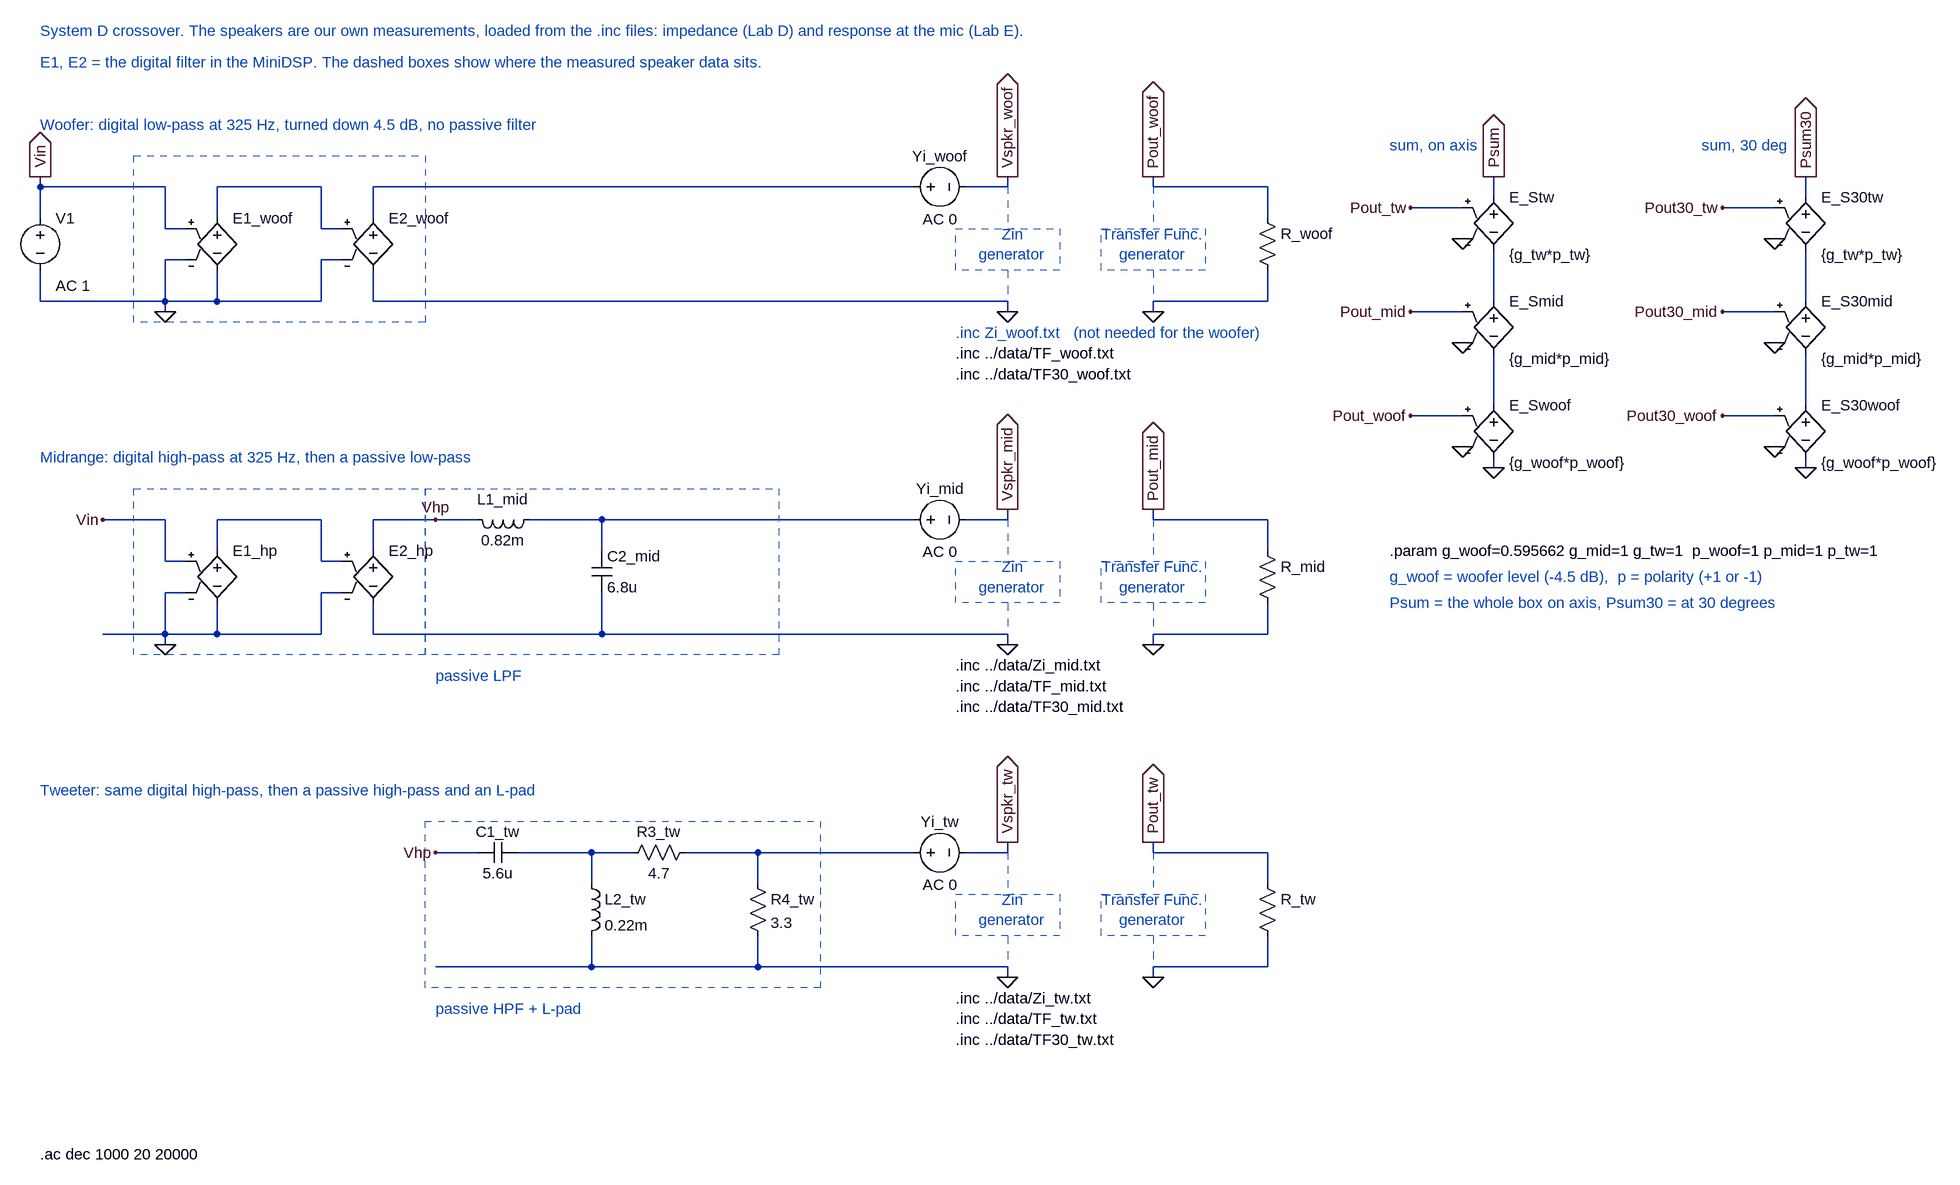
[diagram p0: schematic System_D_course.asc]
System_D_course.asc, the LTspice schematic file:
Version 4
SHEET 1 3600 2400
WIRE -336 64 -336 80
WIRE -336 80 -144 80
WIRE -336 128 -336 80
WIRE -336 208 -336 256
WIRE -336 256 -144 256
WIRE -144 80 -144 144
WIRE -144 144 -112 144
WIRE -112 192 -144 192
WIRE -144 192 -144 256
WIRE -64 128 -64 80
WIRE -64 80 96 80
WIRE 96 80 96 144
WIRE 96 144 128 144
WIRE -64 208 -64 256
WIRE -64 256 96 256
WIRE 96 256 96 192
WIRE 96 192 128 192
WIRE 176 128 176 80
WIRE 176 208 176 256
WIRE -144 256 -144 272
WIRE -144 256 -64 256
WIRE 176 80 1008 80
WIRE 1088 80 1152 80
WIRE 1152 64 1152 80
WIRE 1376 64 1376 80
WIRE 1376 80 1552 80
WIRE 1552 80 1552 128
WIRE 1552 208 1552 256
WIRE 1552 256 1376 256
WIRE 1376 256 1376 272
WIRE 1152 256 176 256
WIRE 1152 256 1152 272
WIRE -240 592 -144 592
WIRE -240 768 -144 768
WIRE -144 592 -144 656
WIRE -144 656 -112 656
WIRE -112 704 -144 704
WIRE -144 704 -144 768
WIRE -64 640 -64 592
WIRE -64 592 96 592
WIRE 96 592 96 656
WIRE 96 656 128 656
WIRE -64 720 -64 768
WIRE -64 768 96 768
WIRE 96 768 96 704
WIRE 96 704 128 704
WIRE 176 640 176 592
WIRE 176 720 176 768
WIRE -144 768 -144 784
WIRE -144 768 -64 768
WIRE 176 592 272 592
WIRE 176 768 272 768
WIRE 272 592 336 592
WIRE 416 592 464 592
WIRE 464 592 528 592
WIRE 528 592 528 640
WIRE 528 704 528 768
WIRE 528 592 592 592
WIRE 272 768 592 768
WIRE 592 592 1008 592
WIRE 1088 592 1152 592
WIRE 1152 576 1152 592
WIRE 1376 576 1376 592
WIRE 1376 592 1552 592
WIRE 1552 592 1552 640
WIRE 1552 720 1552 768
WIRE 1552 768 1376 768
WIRE 1376 768 1376 784
WIRE 1152 768 592 768
WIRE 1152 768 1152 784
WIRE 272 1104 336 1104
WIRE 400 1104 448 1104
WIRE 448 1104 512 1104
WIRE 512 1104 512 1152
WIRE 512 1232 512 1280
WIRE 512 1104 576 1104
WIRE 656 1104 704 1104
WIRE 704 1104 768 1104
WIRE 768 1104 768 1152
WIRE 768 1232 768 1280
WIRE 768 1104 832 1104
WIRE 272 1280 832 1280
WIRE 832 1104 1008 1104
WIRE 1088 1104 1152 1104
WIRE 1152 1088 1152 1104
WIRE 1376 1088 1376 1104
WIRE 1376 1104 1552 1104
WIRE 1552 1104 1552 1152
WIRE 1552 1232 1552 1280
WIRE 1552 1280 1376 1280
WIRE 1376 1280 1376 1296
WIRE 1152 1280 832 1280
WIRE 1152 1280 1152 1296
WIRE 1852 432 1772 432
WIRE 1900 496 1900 512
WIRE 1852 272 1772 272
WIRE 1900 336 1900 416
WIRE 1852 112 1772 112
WIRE 1900 176 1900 256
WIRE 1900 96 1900 64
WIRE 2332 432 2252 432
WIRE 2380 496 2380 512
WIRE 2332 272 2252 272
WIRE 2380 336 2380 416
WIRE 2332 112 2252 112
WIRE 2380 176 2380 256
WIRE 2380 96 2380 64
FLAG -336 64 Vin
IOPIN -336 64 Out
FLAG -144 272 0
FLAG 1152 64 Vspkr_woof
IOPIN 1152 64 Out
FLAG 1376 64 Pout_woof
IOPIN 1376 64 Out
FLAG 1376 272 0
FLAG 1152 272 0
FLAG -240 592 Vin
FLAG -144 784 0
FLAG 272 592 Vhp
FLAG 1152 576 Vspkr_mid
IOPIN 1152 576 Out
FLAG 1376 576 Pout_mid
IOPIN 1376 576 Out
FLAG 1376 784 0
FLAG 1152 784 0
FLAG 272 1104 Vhp
FLAG 1152 1088 Vspkr_tw
IOPIN 1152 1088 Out
FLAG 1376 1088 Pout_tw
IOPIN 1376 1088 Out
FLAG 1376 1296 0
FLAG 1152 1296 0
FLAG 1772 432 Pout_woof
FLAG 1852 480 0
FLAG 1900 512 0
FLAG 1772 272 Pout_mid
FLAG 1852 320 0
FLAG 1772 112 Pout_tw
FLAG 1852 160 0
FLAG 1900 64 Psum
IOPIN 1900 64 Out
FLAG 2252 432 Pout30_woof
FLAG 2332 480 0
FLAG 2380 512 0
FLAG 2252 272 Pout30_mid
FLAG 2332 320 0
FLAG 2252 112 Pout30_tw
FLAG 2332 160 0
FLAG 2380 64 Psum30
IOPIN 2380 64 Out
SYMBOL voltage -336 112 R0
WINDOW 123 24 120 Left 2
WINDOW 39 0 0 Left 0
SYMATTR InstName V1
SYMATTR Value ""
SYMATTR Value2 AC 1
SYMBOL e -64 112 R0
WINDOW 3 24 96 Invisible 2
SYMATTR InstName E1_woof
SYMATTR Value Laplace=(0.000111435745339139+0.000222871490678279*exp(-s*1.04166666666667e-05)+0.000111435745339139*exp(-2*s*1.04166666666667e-05))/(1+-1.96992019814112*exp(-s*1.04166666666667e-05)+0.970365941122475*exp(-2*s*1.04166666666667e-05))
SYMBOL e 176 112 R0
WINDOW 3 24 96 Invisible 2
SYMATTR InstName E2_woof
SYMATTR Value Laplace=(0.000111435745339139+0.000222871490678279*exp(-s*1.04166666666667e-05)+0.000111435745339139*exp(-2*s*1.04166666666667e-05))/(1+-1.96992019814112*exp(-s*1.04166666666667e-05)+0.970365941122475*exp(-2*s*1.04166666666667e-05))
SYMBOL voltage 992 80 R270
WINDOW 0 32 56 VTop 2
WINDOW 3 -32 56 VBottom 2
WINDOW 123 -34 56 VBottom 2
WINDOW 39 0 0 Left 0
SYMATTR InstName Yi_woof
SYMATTR Value ""
SYMATTR Value2 AC 0
SYMBOL res 1536 112 R0
WINDOW 3 36 76 Invisible 2
SYMATTR InstName R_woof
SYMATTR Value 1k
SYMBOL e -64 624 R0
WINDOW 3 24 96 Invisible 2
SYMATTR InstName E1_hp
SYMATTR Value Laplace=(0.985071534815898+-1.9701430696318*exp(-s*1.04166666666667e-05)+0.985071534815898*exp(-2*s*1.04166666666667e-05))/(1+-1.96992019814112*exp(-s*1.04166666666667e-05)+0.970365941122475*exp(-2*s*1.04166666666667e-05))
SYMBOL e 176 624 R0
WINDOW 3 24 96 Invisible 2
SYMATTR InstName E2_hp
SYMATTR Value Laplace=(0.985071534815898+-1.9701430696318*exp(-s*1.04166666666667e-05)+0.985071534815898*exp(-2*s*1.04166666666667e-05))/(1+-1.96992019814112*exp(-s*1.04166666666667e-05)+0.970365941122475*exp(-2*s*1.04166666666667e-05))
SYMBOL ind 432 576 R90
WINDOW 0 0 56 VBottom 2
WINDOW 3 32 56 VTop 2
SYMATTR InstName L1_mid
SYMATTR Value 0.82m
SYMATTR SpiceLine Rser=0
SYMBOL cap 512 640 R0
SYMATTR InstName C2_mid
SYMATTR Value 6.8u
SYMBOL voltage 992 592 R270
WINDOW 0 32 56 VTop 2
WINDOW 3 -32 56 VBottom 2
WINDOW 123 -34 56 VBottom 2
WINDOW 39 0 0 Left 0
SYMATTR InstName Yi_mid
SYMATTR Value ""
SYMATTR Value2 AC 0
SYMBOL res 1536 624 R0
WINDOW 3 36 76 Invisible 2
SYMATTR InstName R_mid
SYMATTR Value 1k
SYMBOL cap 400 1088 R90
WINDOW 0 0 32 VBottom 2
WINDOW 3 32 32 VTop 2
SYMATTR InstName C1_tw
SYMATTR Value 5.6u
SYMBOL ind 496 1136 R0
SYMATTR InstName L2_tw
SYMATTR Value 0.22m
SYMATTR SpiceLine Rser=0
SYMBOL res 672 1088 R90
WINDOW 0 0 56 VBottom 2
WINDOW 3 32 56 VTop 2
SYMATTR InstName R3_tw
SYMATTR Value 4.7
SYMBOL res 752 1136 R0
SYMATTR InstName R4_tw
SYMATTR Value 3.3
SYMBOL voltage 992 1104 R270
WINDOW 0 32 56 VTop 2
WINDOW 3 -32 56 VBottom 2
WINDOW 123 -34 56 VBottom 2
WINDOW 39 0 0 Left 0
SYMATTR InstName Yi_tw
SYMATTR Value ""
SYMATTR Value2 AC 0
SYMBOL res 1536 1136 R0
WINDOW 3 36 76 Invisible 2
SYMATTR InstName R_tw
SYMATTR Value 1k
SYMBOL e 1900 400 R0
WINDOW 3 24 104 Left 2
SYMATTR InstName E_Swoof
SYMATTR Value {g_woof*p_woof}
SYMBOL e 1900 240 R0
WINDOW 3 24 104 Left 2
SYMATTR InstName E_Smid
SYMATTR Value {g_mid*p_mid}
SYMBOL e 1900 80 R0
WINDOW 3 24 104 Left 2
SYMATTR InstName E_Stw
SYMATTR Value {g_tw*p_tw}
SYMBOL e 2380 400 R0
WINDOW 3 24 104 Left 2
SYMATTR InstName E_S30woof
SYMATTR Value {g_woof*p_woof}
SYMBOL e 2380 240 R0
WINDOW 3 24 104 Left 2
SYMATTR InstName E_S30mid
SYMATTR Value {g_mid*p_mid}
SYMBOL e 2380 80 R0
WINDOW 3 24 104 Left 2
SYMATTR InstName E_S30tw
SYMATTR Value {g_tw*p_tw}
TEXT -336 -160 Left 2 ;System D crossover. The speakers are our own measurements, loaded from the .inc files: impedance (Lab D) and response at the mic (Lab E).
TEXT -336 -112 Left 2 ;E1, E2 = the digital filter in the MiniDSP. The dashed boxes show where the measured speaker data sits.
TEXT -336 -16 Left 2 ;Woofer: digital low-pass at 325 Hz, turned down 4.5 dB, no passive filter
TEXT 1160 168 Center 2 ;Zin\ngenerator
TEXT 1376 168 Center 2 ;Transfer Func.\ngenerator
TEXT 1072 304 Left 2 ;.inc Zi_woof.txt   (not needed for the woofer)
TEXT 1072 336 Left 2 !.inc ../data/TF_woof.txt
TEXT 1072 368 Left 2 !.inc ../data/TF30_woof.txt
TEXT -336 496 Left 2 ;Midrange: digital high-pass at 325 Hz, then a passive low-pass
TEXT 272 832 Left 2 ;passive LPF
TEXT 1160 680 Center 2 ;Zin\ngenerator
TEXT 1376 680 Center 2 ;Transfer Func.\ngenerator
TEXT 1072 816 Left 2 !.inc ../data/Zi_mid.txt
TEXT 1072 848 Left 2 !.inc ../data/TF_mid.txt
TEXT 1072 880 Left 2 !.inc ../data/TF30_mid.txt
TEXT -336 1008 Left 2 ;Tweeter: same digital high-pass, then a passive high-pass and an L-pad
TEXT 272 1344 Left 2 ;passive HPF + L-pad
TEXT 1160 1192 Center 2 ;Zin\ngenerator
TEXT 1376 1192 Center 2 ;Transfer Func.\ngenerator
TEXT 1072 1328 Left 2 !.inc ../data/Zi_tw.txt
TEXT 1072 1360 Left 2 !.inc ../data/TF_tw.txt
TEXT 1072 1392 Left 2 !.inc ../data/TF30_tw.txt
TEXT 1740 16 Left 2 ;sum, on axis
TEXT 2220 16 Left 2 ;sum, 30 deg
TEXT 1740 640 Left 2 !.param g_woof=0.595662 g_mid=1 g_tw=1  p_woof=1 p_mid=1 p_tw=1
TEXT 1740 680 Left 2 ;g_woof = woofer level (-4.5 dB),  p = polarity (+1 or -1)
TEXT 1740 720 Left 2 ;Psum = the whole box on axis, Psum30 = at 30 degrees
TEXT -336 1568 Left 2 !.ac dec 1000 20 20000
RECTANGLE Normal 256 288 -192 32 2
LINE Normal 1152 80 1152 144 2
LINE Normal 1152 208 1152 256 2
LINE Normal 1376 80 1376 144 2
LINE Normal 1376 208 1376 256 2
RECTANGLE Normal 1232 208 1072 144 2
RECTANGLE Normal 1456 208 1296 144 2
RECTANGLE Normal 256 800 -192 544 2
RECTANGLE Normal 800 800 256 544 2
LINE Normal 1152 592 1152 656 2
LINE Normal 1152 720 1152 768 2
LINE Normal 1376 592 1376 656 2
LINE Normal 1376 720 1376 768 2
RECTANGLE Normal 1232 720 1072 656 2
RECTANGLE Normal 1456 720 1296 656 2
RECTANGLE Normal 864 1312 256 1056 2
LINE Normal 1152 1104 1152 1168 2
LINE Normal 1152 1232 1152 1280 2
LINE Normal 1376 1104 1376 1168 2
LINE Normal 1376 1232 1376 1280 2
RECTANGLE Normal 1232 1232 1072 1168 2
RECTANGLE Normal 1456 1232 1296 1168 2

The netlist it stands for:
* System_D_course.asc
V1 Vin 0 AC 1
E1_woof N001 0 Vin 0 Laplace=(0.000111435745339139+0.000222871490678279*exp(-s*1.04166666666667e-05)+0.000111435745339139*exp(-2*s*1.04166666666667e-05))/(1+-1.96992019814112*exp(-s*1.04166666666667e-05)+0.970365941122475*exp(-2*s*1.04166666666667e-05))
E2_woof N002 0 N001 0 Laplace=(0.000111435745339139+0.000222871490678279*exp(-s*1.04166666666667e-05)+0.000111435745339139*exp(-2*s*1.04166666666667e-05))/(1+-1.96992019814112*exp(-s*1.04166666666667e-05)+0.970365941122475*exp(-2*s*1.04166666666667e-05))
V§Yi_woof N002 Vspkr_woof AC 0
R_woof Pout_woof 0 1k
E1_hp N003 0 Vin 0 Laplace=(0.985071534815898+-1.9701430696318*exp(-s*1.04166666666667e-05)+0.985071534815898*exp(-2*s*1.04166666666667e-05))/(1+-1.96992019814112*exp(-s*1.04166666666667e-05)+0.970365941122475*exp(-2*s*1.04166666666667e-05))
E2_hp Vhp 0 N003 0 Laplace=(0.985071534815898+-1.9701430696318*exp(-s*1.04166666666667e-05)+0.985071534815898*exp(-2*s*1.04166666666667e-05))/(1+-1.96992019814112*exp(-s*1.04166666666667e-05)+0.970365941122475*exp(-2*s*1.04166666666667e-05))
L1_mid N004 Vhp 0.82m Rser=0
C2_mid N004 0 6.8u
V§Yi_mid N004 Vspkr_mid AC 0
R_mid Pout_mid 0 1k
C1_tw N005 Vhp 5.6u
L2_tw N005 0 0.22m Rser=0
R3_tw N006 N005 4.7
R4_tw N006 0 3.3
V§Yi_tw N006 Vspkr_tw AC 0
R_tw Pout_tw 0 1k
E_Swoof N007 0 Pout_woof 0 {g_woof*p_woof}
E_Smid N008 N007 Pout_mid 0 {g_mid*p_mid}
E_Stw Psum N008 Pout_tw 0 {g_tw*p_tw}
E_S30woof N009 0 Pout30_woof 0 {g_woof*p_woof}
E_S30mid N010 N009 Pout30_mid 0 {g_mid*p_mid}
E_S30tw Psum30 N010 Pout30_tw 0 {g_tw*p_tw}
* System D crossover. The speakers are our own measurements, loaded from the .inc files: impedance (Lab D) and response at the mic (Lab E).
* E1, E2 = the digital filter in the MiniDSP. The dashed boxes show where the measured speaker data sits.
* Woofer: digital low-pass at 325 Hz, turned down 4.5 dB, no passive filter
* Zin
* generator
* Transfer Func.
* generator
* .inc Zi_woof.txt   (not needed for the woofer)
.inc ../data/TF_woof.txt
.inc ../data/TF30_woof.txt
* Midrange: digital high-pass at 325 Hz, then a passive low-pass
* passive LPF
* Zin
* generator
* Transfer Func.
* generator
.inc ../data/Zi_mid.txt
.inc ../data/TF_mid.txt
.inc ../data/TF30_mid.txt
* Tweeter: same digital high-pass, then a passive high-pass and an L-pad
* passive HPF + L-pad
* Zin
* generator
* Transfer Func.
* generator
.inc ../data/Zi_tw.txt
.inc ../data/TF_tw.txt
.inc ../data/TF30_tw.txt
* sum, on axis
* sum, 30 deg
.param g_woof=0.595662 g_mid=1 g_tw=1  p_woof=1 p_mid=1 p_tw=1
* g_woof = woofer level (-4.5 dB),  p = polarity (+1 or -1)
* Psum = the whole box on axis, Psum30 = at 30 degrees
.ac dec 1000 20 20000
.backanno
.end